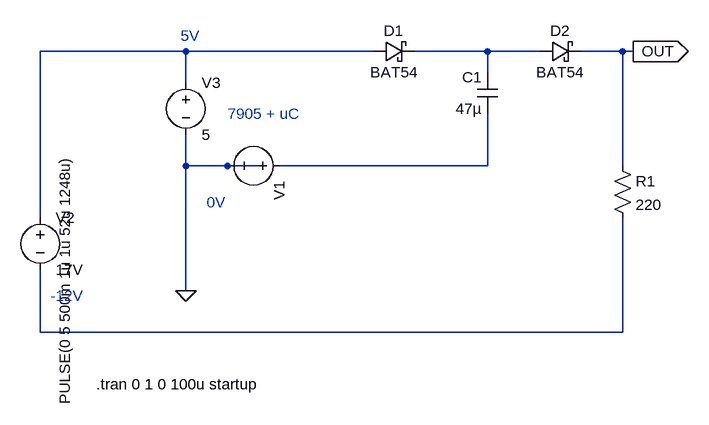
[diagram p0: schematic DriverA3.asc]
DriverA3.asc, the LTspice schematic file:
Version 4
SHEET 1 1000 680
WIRE -128 96 -352 96
WIRE 160 96 -128 96
WIRE 336 96 224 96
WIRE 416 96 336 96
WIRE 544 96 480 96
WIRE 560 96 544 96
WIRE 336 128 336 96
WIRE -128 144 -128 96
WIRE -128 272 -128 224
WIRE -64 272 -128 272
WIRE -16 272 -64 272
WIRE 336 272 336 192
WIRE 336 272 16 272
WIRE 544 272 544 96
WIRE -352 352 -352 96
WIRE -128 464 -128 272
WIRE -352 528 -352 432
WIRE 544 528 544 352
WIRE 544 528 -352 528
FLAG 560 96 OUT
IOPIN 560 96 Out
FLAG -128 464 0
SYMBOL voltage 32 272 R90
WINDOW 3 -18 346 Left 2
WINDOW 123 0 0 Left 0
WINDOW 39 -4 138 Left 2
SYMATTR InstName V1
SYMATTR Value PULSE(0 5 500m 1u 1u 52u 1248u)
SYMBOL cap 352 192 R180
WINDOW 0 24 56 Left 2
WINDOW 3 24 8 Left 2
SYMATTR InstName C1
SYMATTR Value 47µ
SYMBOL schottky 160 112 R270
WINDOW 0 32 32 VTop 2
WINDOW 3 0 32 VBottom 2
SYMATTR InstName D1
SYMATTR Value BAT54
SYMATTR Description Diode
SYMATTR Type diode
SYMBOL schottky 416 112 R270
WINDOW 0 32 32 VTop 2
WINDOW 3 0 32 VBottom 2
SYMATTR InstName D2
SYMATTR Value BAT54
SYMATTR Description Diode
SYMATTR Type diode
SYMBOL voltage -352 336 R0
WINDOW 123 0 0 Left 0
WINDOW 39 24 124 Left 2
SYMATTR InstName V2
SYMATTR Value 17V
SYMBOL res 528 256 R0
SYMATTR InstName R1
SYMATTR Value 220
SYMBOL voltage -128 128 R0
WINDOW 123 0 0 Left 0
WINDOW 39 0 0 Left 0
SYMATTR InstName V3
SYMATTR Value 5
TEXT -266 608 Left 2 !.tran 0 1 0 100u startup
TEXT -64 192 Left 2 ;7905 + uC
TEXT -136 72 Left 2 ;5V
TEXT -96 328 Left 2 ;0V
TEXT -336 472 Left 2 ;-12V

The netlist it stands for:
* DriverA3.asc
V1 N003 0 PULSE(0 5 500m 1u 1u 52u 1248u)
C1 N003 N002 47µ
D1 N001 N002 BAT54
D2 N002 OUT BAT54
V2 N001 N004 17V
R1 OUT N004 220
V3 N001 0 5
.model D D
.lib standard.dio
.tran 0 1 0 100u startup
* 7905 + uC
* 5V
* 0V
* -12V
.backanno
.end